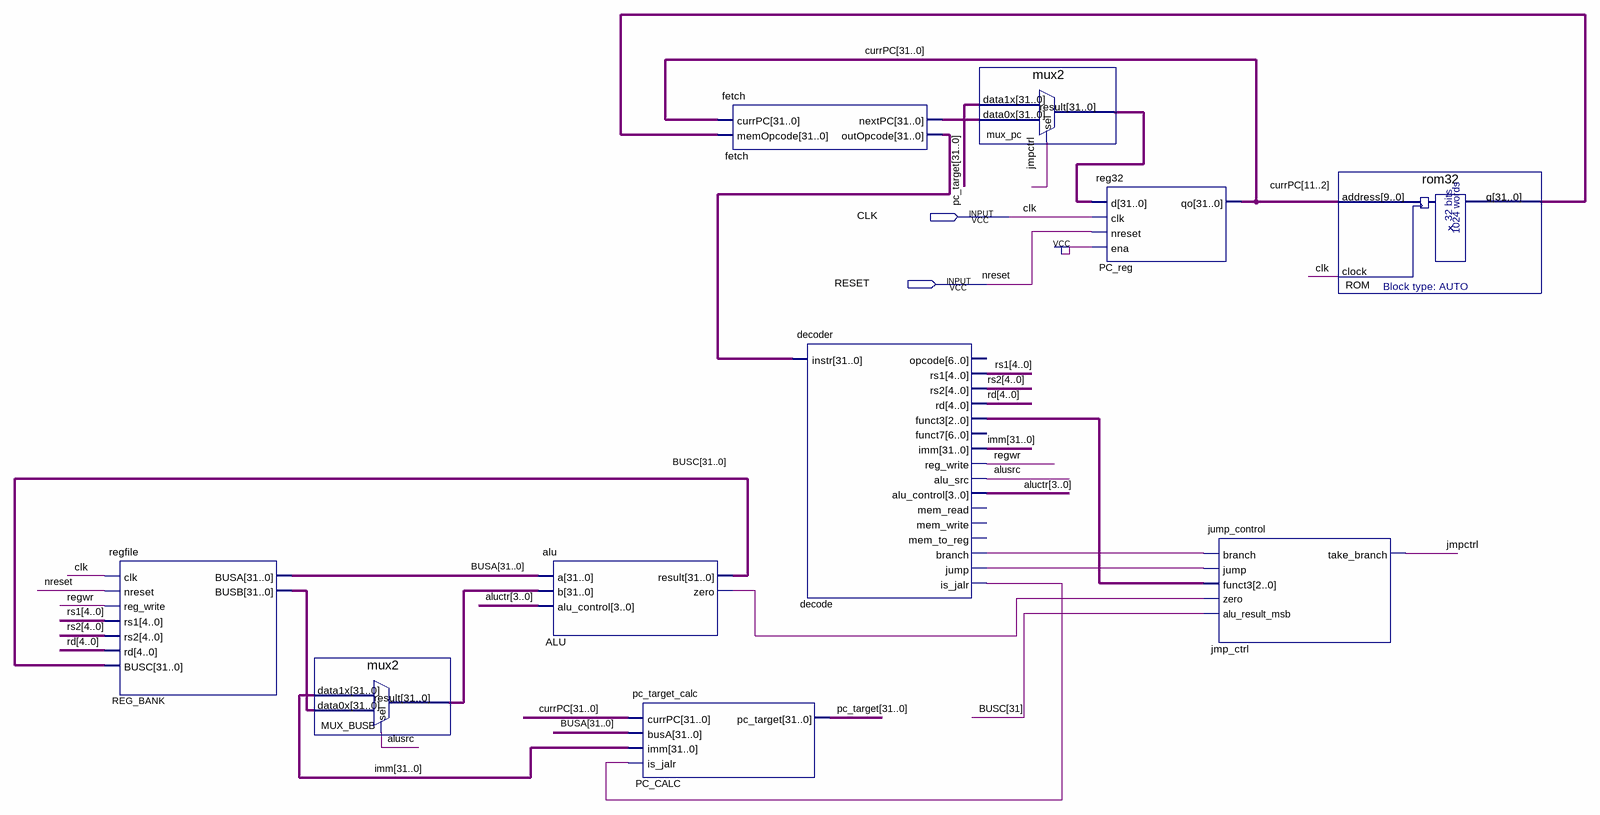
[diagram p0: schematic sheet]
// Quartus schematic ProcesadorTP.bdf as structural Verilog: 10 symbols, 2 pins
module ProcesadorTP (
  input  CLK,
  input  RESET
);

  wire ALU_zero, alusrc, decode_branch, decode_is_jalr, decode_jump, jmpctrl, regwr;
  wire [2:0] decode_funct3;
  wire [3:0] aluctr;
  wire [4:0] rd, rs1, rs2;
  wire [31:0] BUSA, BUSC, currPC, fetch_nextpc, fetch_outopcode, imm, MUX_BUSB_result, mux_pc_result,
       pc_target, REG_BANK_busb, ROM_q;

  regfile REG_BANK (
    .clk(CLK), .nreset(RESET), .reg_write(regwr), .rs1(rs1), .rs2(rs2), .rd(rd), .BUSC(BUSC), .BUSA(BUSA),
    .BUSB(REG_BANK_busb));
  mux2 MUX_BUSB (.data1x(imm), .data0x(REG_BANK_busb), .sel(alusrc), .result(MUX_BUSB_result));
  alu ALU (.a(BUSA), .b(MUX_BUSB_result), .alu_control(aluctr), .result(BUSC), .zero(ALU_zero));
  pc_target_calc PC_CALC (.currPC(currPC), .busA(BUSA), .imm(imm), .is_jalr(decode_is_jalr), .pc_target(pc_target));
  fetch fetch (.currPC(currPC), .memOpcode(ROM_q), .nextPC(fetch_nextpc), .outOpcode(fetch_outopcode));
  decoder decode (
    .instr(fetch_outopcode), .rs1(rs1), .rs2(rs2), .rd(rd), .funct3(decode_funct3), .imm(imm),
    .reg_write(regwr), .alu_src(alusrc), .alu_control(aluctr), .branch(decode_branch), .jump(decode_jump),
    .is_jalr(decode_is_jalr));  // open: opcode, funct7, mem_read, mem_write, mem_to_reg
  mux2 mux_pc (.data1x(pc_target), .data0x(fetch_nextpc), .sel(jmpctrl), .result(mux_pc_result));
  reg32 PC_reg (.d(mux_pc_result), .clk(CLK), .nreset(RESET), .ena(1'b1), .qo(currPC));
  jump_control jmp_ctrl (
    .branch(decode_branch), .jump(decode_jump), .funct3(decode_funct3), .zero(ALU_zero),
    .alu_result_msb(BUSC[31]), .take_branch(jmpctrl));
  rom32 ROM (.address(currPC[11:2]), .clock(CLK), .q(ROM_q));

  // Other names for the same wires on the sheet: nreset = RESET
endmodule
